# Altium project NB3000AL.PRJPCB (part 1 of 4)
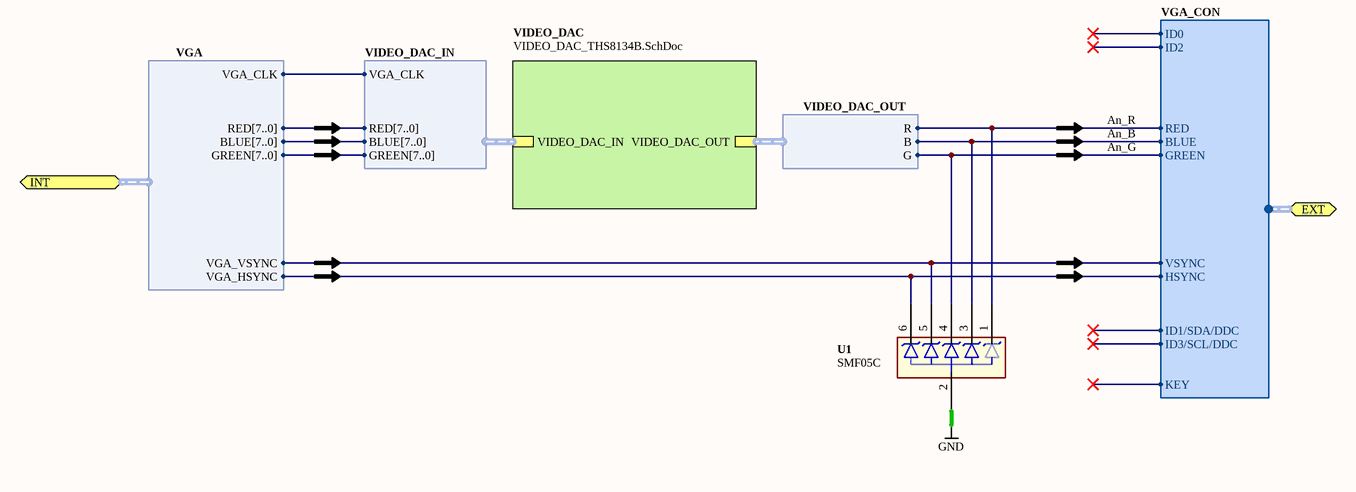
[diagram p0: VGA_OUT.SCHDOC]
ProjectAddress1: 3 Minna Close; ProjectAddress2: Belrose; ProjectAddress3: NSW 2085; ProjectAddress4: Australia; ProjectAssyNum: D-820-0053; ProjectOrganization: Altium Limited; ProjectRevision: 01; ProjectTitle: NB3000AL - Altera; ProjectTotalSheets: 106
38 sheets, 516 parts. Net scope: hierarchical (ports join the sheet entries above them; power ports are global).
Board files: NB3000AL.PcbDoc, NB3000AL_Panel.PcbDoc
Sheets:
  VGA_OUT.SCHDOC
    VIDEO_DAC = VIDEO_DAC_THS8134B.SchDoc
  Audio_Codec.SchDoc
    CODEC_CS4270 = AUDIO_CODEC_CS4270.SchDoc
  PSU.SchDoc
  FPGA.SCHDOC
    USER_DECOUPLING_CAPS_1V2 = FPGA_Bypass_1V2.SCHDOC
    USER_DECOUPLING_CAPS_3V3 = FPGA_Bypass_3V3.SCHDOC
    U_FPGA_Power = FPGA_NonIO.SchDoc
    PULLDOWN = PULLDNx3.SCHDOC
    PULLDOWN = PULLDNx3.SCHDOC
    PULLDOWN = PULLDNx3.SCHDOC
    PULLDOWN = PULLDNx3.SCHDOC
    PULLDOWN = PULLDNx3.SCHDOC
    PULLDOWN = PULLDNx3.SCHDOC
    PULLDOWN = PULLDNx3.SCHDOC
    PULLDOWN = PULLDNx3.SCHDOC
  LED_RGB_SMDx8.SCHDOC
  PWJACK+SWITCH.SchDoc
  Ethernet_RTL8201CL.SchDoc
  HOST_JTAG.SchDoc
  USERPWR.SchDoc
  Host_FPGA.SchDoc
    HOST_NonIO = HOST_FPGA_NonIO.SchDoc
    HOST_DECOUPLING_CAPS_1V2 = FPGA_Bypass_1V2.SCHDOC
    HOST_DECOUPLING_CAPS_3V3 = FPGA_Bypass_3V3.SCHDOC
    PULLDOWN = PULLDNx3.SCHDOC
    PULLDOWN = PULLDNx3.SCHDOC
  TSC_XPT2046.SchDoc
  USB_CY7C68001-56LFC.SchDoc
  OSC_24MHZ.SchDoc
  CON_AUDIO_AC99_NOMIC.SchDoc
  CON_FFC40_LCDTFT.SCHDOC
  Mounts.SchDoc
  ADC_ADC084S021_SPI.SchDoc
  CON_NB3000_ATE_INTF.SchDoc
  AUDIO_AMP_NB2C.SchDoc
    AMP_PT2300 = AUDIO_AMP_PT2300.SchDoc
  CLK_ICS307-02_PLL.SchDoc
  CON_ADCx4_KMRJIO3_5MM_6WAY.SchDoc
  CON_BATT_COIN.SchDoc
  CON_DACx4_KMRJIO3_5MM_6WAY.SchDoc
  CON_MINI_USBB_RA_KME04-USBMU03A01-1.SchDoc
  CON_ETHERNET_RJ45_LEDS.SchDoc
  CON_NB3000_LEDKB.SCHDOC
  CON_MIDI_DIN5.SCHDOC
  CON_EXT_SPK.SchDoc
  1WB_DS2502_ID.SchDoc
  CLK_PCF2123_RTC.SchDoc

## Sheet VGA_OUT.SCHDOC: VGA Ouput
size A4; DocumentNumber: 2; PageSetup: Record=PageOptions|CenterHorizontal=True|CenterVertical=True|PrintScale=0.97|XCorrection=1.00|YCorrection=1.00|PrintKind=1|BorderSize=5000000|LeftOffset=0|BottomOffset=0|Orientation=2|PaperLength=1000|PaperWidth=1000|Scale=100|PaperSource=7|PrintQuality=-4|MediaType=1|DitherType=10|PaperKind=A4 (210 x 297 mm)|PrintScaleMode=1

### Parts
(Parts that share a designator on the sheet are numbered #1, #2 ... from top to bottom, then left to right.)
U1#1  SMF05C  [SC70_6L]

### Sub-sheets
VIDEO_DAC = VIDEO_DAC_THS8134B.SchDoc: VIDEO_DAC_OUT (harness VIDEO_DAC_OUT), VIDEO_DAC_IN (harness VIDEO_DAC_IN)

### Ports
EXT (harness VGA_CON), INT (harness VGA)

### Harnesses
VIDEO_DAC_IN: RED[7..0], GREEN[7..0], BLUE[7..0], VGA_CLK
VIDEO_DAC_OUT: B, R, G
VGA: RED[7..0], GREEN[7..0], BLUE[7..0], VGA_CLK, VGA_VSYNC, VGA_HSYNC
VGA_CON: RED, GREEN, BLUE, VSYNC, HSYNC, KEY, ID2, ID3/SCL/DDC, ID1/SDA/DDC, ID0

### Nets
GND: U1#1.2
An_B: U1#1.3 ; sheet VIDEO_DAC/VIDEO_DAC_OUT.B, port EXT.BLUE
An_G: U1#1.4 ; sheet VIDEO_DAC/VIDEO_DAC_OUT.G, port EXT.GREEN
An_R: U1#1.1 ; sheet VIDEO_DAC/VIDEO_DAC_OUT.R, port EXT.RED
NetU1#1_5: U1#1.5 ; port INT.VGA_VSYNC, port EXT.VSYNC
NetU1#1_6: U1#1.6 ; port INT.VGA_HSYNC, port EXT.HSYNC
NetU1#2_26: sheet VIDEO_DAC/VIDEO_DAC_IN.VGA_CLK, port INT.VGA_CLK

### Notes on the sheet
- Sheet Title
- Project Title
- Size:
- Date:
- A4
- Assy:
- Time:
- Revision:
- Sheet
- of
- File:

### Library data of the parts
U1#1 = D-157-0000: TVS Diode Array  For ESD and Latch-Up Protection; Junction Capacitance: 130 pF; Peak Pulse Current: 8 A; Peak Pulse Power: 100 W; Reverse Breakdown Voltage: 6 V; Status: Unreleased; Category: Diode-Protection

## Sheet VIDEO_DAC_THS8134B.SchDoc: Video DAC
size A4; Organization: Altium Limited.; Address1: Level 3, 12a Rodborough Rd; Address2: Frenchs Forest 2086; Address3: NSW; Address4: AUSTRALIA; DocumentNumber: 62; SheetNumber: 63; SheetTotal: 78
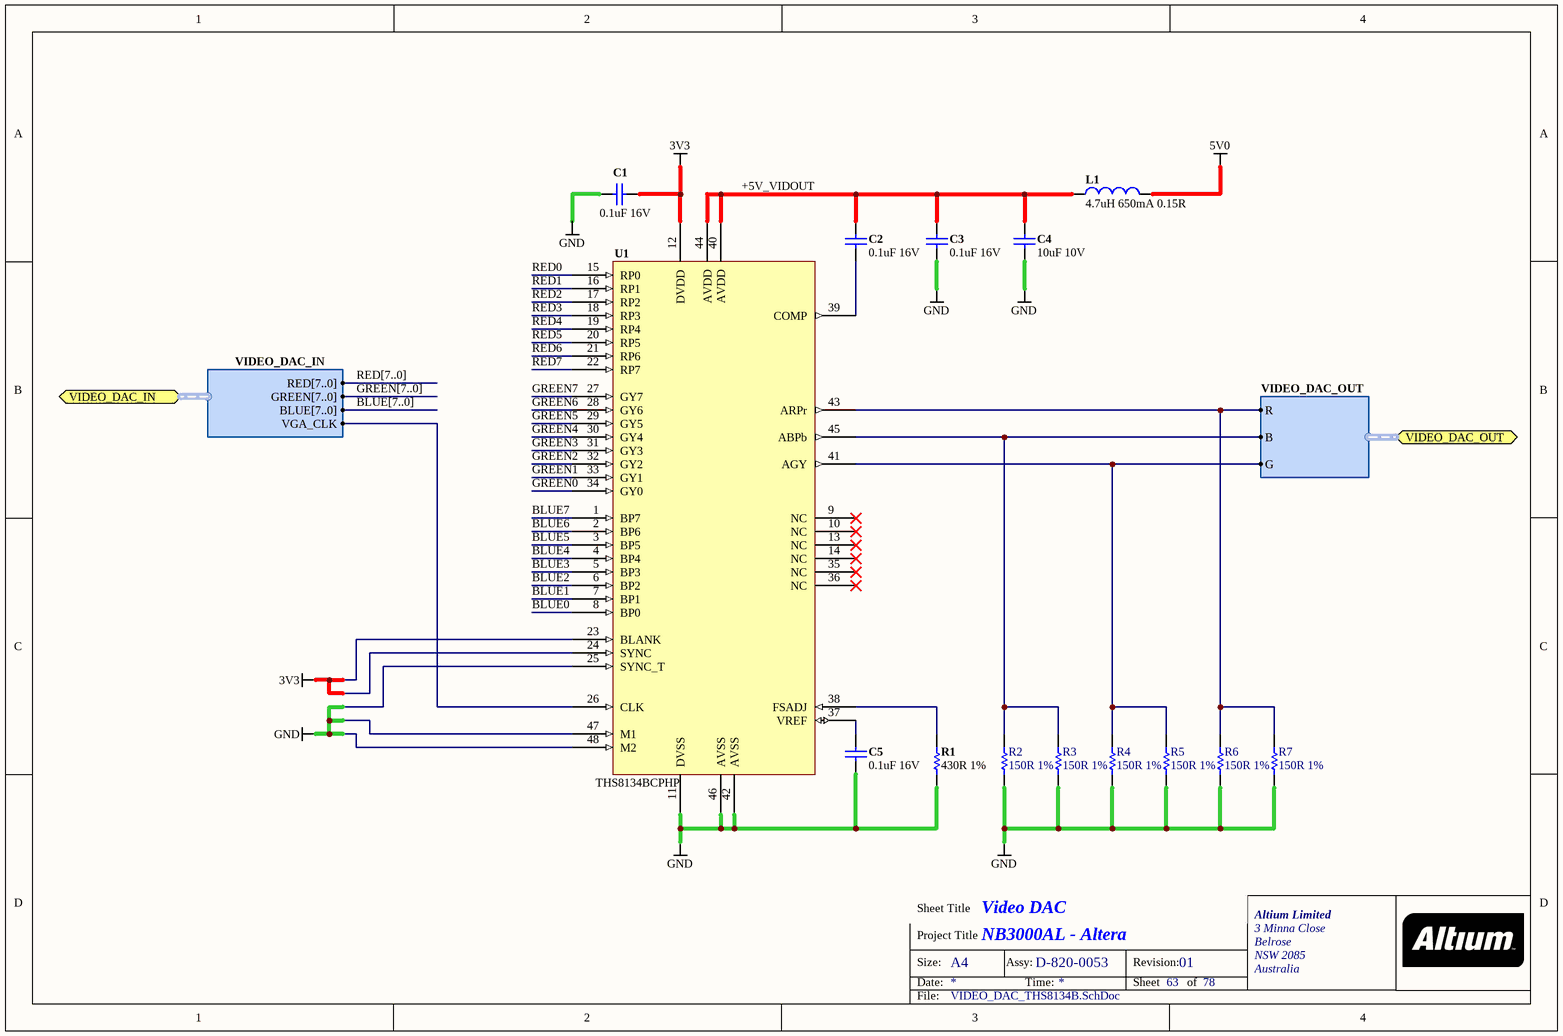
[diagram p1: VIDEO_DAC_THS8134B.SchDoc]

### Parts
(Parts that share a designator on the sheet are numbered #1, #2 ... from top to bottom, then left to right.)
C1#1  0.1uF 16V  [CAPC1005-STAR]
C2#1  0.1uF 16V  [CAPC1005-STAR]
C3#1  0.1uF 16V  [CAPC1005-STAR]
C4#1  10uF 10V  [CAPC2012-STAR]
C5#1  0.1uF 16V  [CAPC1005-STAR]
L1#1  4.7uH 650mA 0.15R  [INDC3225]
R1#1  430R 1%  [RESC1005-STAR]
R2#1  150R 1%  [RESC1005-STAR]
R3#1  150R 1%  [RESC1005-STAR]
R4#1  150R 1%  [RESC1005-STAR]
R5#1  150R 1%  [RESC1005-STAR]
R6#1  150R 1%  [RESC1005-STAR]
R7#1  150R 1%  [RESC1005-STAR]
U1#2  THS8134BCPHP  [TSQFP50P900X900_HS-48]

### Ports
VIDEO_DAC_IN (harness VIDEO_DAC_IN), VIDEO_DAC_OUT (harness VIDEO_DAC_OUT)

### Harnesses
VIDEO_DAC_OUT: B, R, G
VIDEO_DAC_IN: RED[7..0], GREEN[7..0], BLUE[7..0], VGA_CLK

### Nets
3V3: C1#1.1 U1#2.12(DVDD) U1#2.23(BLANK) U1#2.24(SYNC)
5V0: L1#1.1
GND: C1#1.2 C3#1.2 C4#1.1 C5#1.2 R1#1.1 R2#1.2 R3#1.1 R4#1.2 R5#1.1 R6#1.1 R7#1.1 U1#2.11(DVSS) U1#2.25(SYNC_T) U1#2.42(AVSS) U1#2.46(AVSS) U1#2.47(M1) U1#2.48(M2)
+5V_VIDOUT: C2#1.1 C3#1.1 C4#1.2 L1#1.2 U1#2.40(AVDD) U1#2.44(AVDD)
An_B: R2#1.1 R3#1.2 U1#2.45(ABPb) ; port VIDEO_DAC_OUT.B
An_G: R4#1.1 R5#1.2 U1#2.41(AGY) ; port VIDEO_DAC_OUT.G
An_R: R6#1.2 R7#1.2 U1#2.43(ARPr) ; port VIDEO_DAC_OUT.R
BLUE0: U1#2.8(BP0)
BLUE1: U1#2.7(BP1)
BLUE2: U1#2.6(BP2)
BLUE3: U1#2.5(BP3)
BLUE4: U1#2.4(BP4)
BLUE5: U1#2.3(BP5)
BLUE6: U1#2.2(BP6)
BLUE7: U1#2.1(BP7)
GREEN0: U1#2.34(GY0)
GREEN1: U1#2.33(GY1)
GREEN2: U1#2.32(GY2)
GREEN3: U1#2.31(GY3)
GREEN4: U1#2.30(GY4)
GREEN5: U1#2.29(GY5)
GREEN6: U1#2.28(GY6)
GREEN7: U1#2.27(GY7)
RED0: U1#2.15(RP0)
RED1: U1#2.16(RP1)
RED2: U1#2.17(RP2)
RED3: U1#2.18(RP3)
RED4: U1#2.19(RP4)
RED5: U1#2.20(RP5)
RED6: U1#2.21(RP6)
RED7: U1#2.22(RP7)
NetC2#1_2: C2#1.2 U1#2.39(COMP)
NetC5#1_1: C5#1.1 U1#2.37(VREF)
NetR1#1_2: R1#1.2 U1#2.38(FSADJ)
NetU1#2_26: U1#2.26(CLK) ; port VIDEO_DAC_IN.VGA_CLK

Not connected (* = marked no-connect by the designer): U1#2 9(NC)* 10(NC)* 13(NC)* 14(NC)* 35(NC)* 36(NC)*

### Buses and harness runs
bus BLUE[7..0]
bus GREEN[7..0]
bus RED[7..0]

### Notes on the sheet
- Sheet Title
- Project Title
- Size:
- Date:
- A4
- Assy:
- Time:
- Revision:
- Sheet
- of
- File:

### Library data of the parts
C1#1 C2#1 C3#1 C5#1 = D-101-0080: Capacitor, Ceramic, 0.1uF 10% 16V 0402 (1005) X7R; Polarity: Non-Polarized; Capacitance: 0.1 uF; Category: Capacitor; Dielectric: X7R; Mounting Technology: Surface Mount; Rated Voltage: 16 V; Status: Production; Technology: Ceramic; Tolerance: 10 %
C4#1 = D-101-0087: Capacitor, Ceramic, 10uF 10% 10V 0805 (2012) X5R; Polarity: Non-Polarized; Capacitance: 10 uF; Category: Capacitor; Dielectric: X5R; Mounting Technology: Surface Mount; Rated Voltage: 10 V; Status: Unreleased; Technology: None; Tolerance: 10 %
L1#1 = D-102-0005: Inductor, 4.7uH 650mA 0.15R 1210 (3225) LQH32CN4R7M11L; Category: Inductor; Status: Production
R1#1 = D-100-0096: Resistor, 430R 1% 0402 (1005); Power Rating: 63 mW; Category: Resistor; Mounting Technology: Surface Mount; Resistance: 430 R; Status: Production; Tolerance: 1 %
R2#1 R3#1 R4#1 R5#1 R6#1 R7#1 = D-100-0005: Resistor, 150R 1% 0402 (1005); Power Rating: 63mW; Category: Resistor; Mounting Technology: Surface Mount; Resistance: 150R; Status: Unreleased; Tolerance: 1%
U1#2 = D-222-0000: THS8134BCPHP, Triple 8-Bit, 80 MSPS Video DAC with Tri-Level Sync Generation; Status: Production; Category: IC-DAC

## Sheet Audio_Codec.SchDoc: Audio CODEC Top
size A4; DocumentNumber: 4
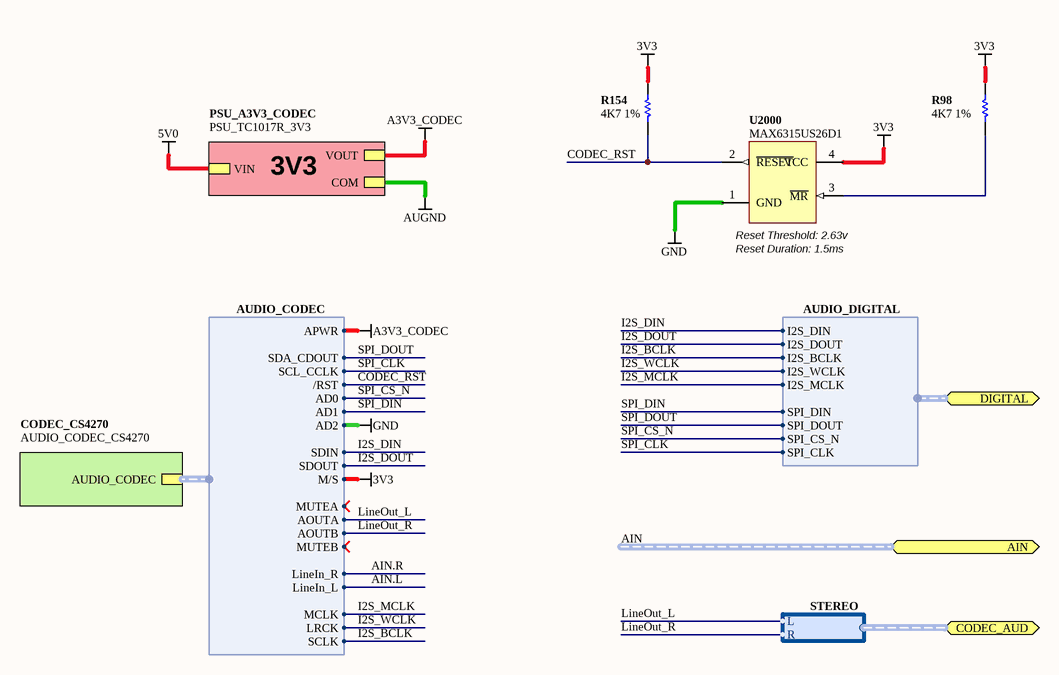
[diagram p2: Audio_Codec.SchDoc]

### Parts
(Parts that share a designator on the sheet are numbered #1, #2 ... from top to bottom, then left to right.)
R98  4K7 1%  [RESC1005-STAR]
R154#1  4K7 1%  [RESC1005-STAR]
U2000  MAX6315US26D1  [SOT143]

### Sub-sheets
CODEC_CS4270 = AUDIO_CODEC_CS4270: AUDIO_CODEC (harness AUDIO_CODEC)
PSU_A3V3_CODEC = PSU_TC1017R_3V3 (file not in this document): VIN, VOUT, COM

### Ports
AIN (harness AUDIO_IN), CODEC_AUD (harness STEREO), DIGITAL (harness AUDIO_DIGITAL)

### Harnesses
AUDIO_CODEC: SDOUT, SDIN, SCLK, LRCK, MCLK, M/S, LineIn_L, LineIn_R, AOUTA, AOUTB, APWR, SCL_CCLK, AD1, SDA_CDOUT, AD0, AD2, /RST, MUTEA, MUTEB
AUDIO_DIGITAL: I2S_DOUT, I2S_DIN, I2S_BCLK, I2S_WCLK, I2S_MCLK, SPI_CLK, SPI_DIN, SPI_DOUT, SPI_CS_N
STEREO: L, R

### Nets
3V3: R98.2 R154#1.2 U2000.4(VCC) ; sheet CODEC_CS4270/AUDIO_CODEC.M/S
A3V3_CODEC: sheet PSU_A3V3_CODEC/VOUT, sheet CODEC_CS4270/AUDIO_CODEC.APWR
GND: U2000.1(GND) ; sheet CODEC_CS4270/AUDIO_CODEC.AD2
CODEC_RST: R154#1.1 U2000.2(~{RESET}) ; sheet CODEC_CS4270/AUDIO_CODEC./RST
I2S_BCLK: sheet CODEC_CS4270/AUDIO_CODEC.SCLK, port DIGITAL.I2S_BCLK
I2S_DIN: sheet CODEC_CS4270/AUDIO_CODEC.SDIN, port DIGITAL.I2S_DIN
I2S_DOUT: sheet CODEC_CS4270/AUDIO_CODEC.SDOUT, port DIGITAL.I2S_DOUT
I2S_MCLK: sheet CODEC_CS4270/AUDIO_CODEC.MCLK, port DIGITAL.I2S_MCLK
I2S_WCLK: sheet CODEC_CS4270/AUDIO_CODEC.LRCK, port DIGITAL.I2S_WCLK
LineOut_L: sheet CODEC_CS4270/AUDIO_CODEC.AOUTA, port CODEC_AUD.L
LineOut_R: sheet CODEC_CS4270/AUDIO_CODEC.AOUTB, port CODEC_AUD.R
SPI_CLK: sheet CODEC_CS4270/AUDIO_CODEC.SCL_CCLK, port DIGITAL.SPI_CLK
SPI_CS_N: sheet CODEC_CS4270/AUDIO_CODEC.AD0, port DIGITAL.SPI_CS_N
SPI_DIN: sheet CODEC_CS4270/AUDIO_CODEC.AD1, port DIGITAL.SPI_DIN
SPI_DOUT: sheet CODEC_CS4270/AUDIO_CODEC.SDA_CDOUT, port DIGITAL.SPI_DOUT
NetR98_1: R98.1 U2000.3(~{MR})

### Buses and harness runs
harness AIN = port AIN

### Notes on the sheet
- 3V3
- (near U2000) Reset Threshold: 2.63v
- (near U2000) Reset Duration: 1.5ms
- Sheet Title
- Project Title
- Size:
- Date:
- A4
- Assy:
- Time:
- Revision:
- Sheet
- of
- File:

### Library data of the parts
R98 R154#1 = D-100-0088: Resistor, 4K7 1% 0402 (1005); Power Rating: 63 mW; Resistance: 4.7 K; Category: Resistor; Mounting Technology: Surface Mount; Status: Production; Tolerance: 1 %
U2000 = D-243-0000: MAX6315, Open-Drain Output SOT Reset IC, Customized Reset Thresholds, Timeout Delays; Category: IC-Other; Status: Production

## Sheet AUDIO_CODEC_CS4270.SchDoc: Audio CODEC
size A4; DocumentNumber: 5; SheetNumber: 5; SheetTotal: 100; Organization: Altium Limited.; Address1: Level 3, 12a Rodborough Rd; Address2: Frenchs Forest 2086; Address3: NSW; Address4: AUSTRALIA
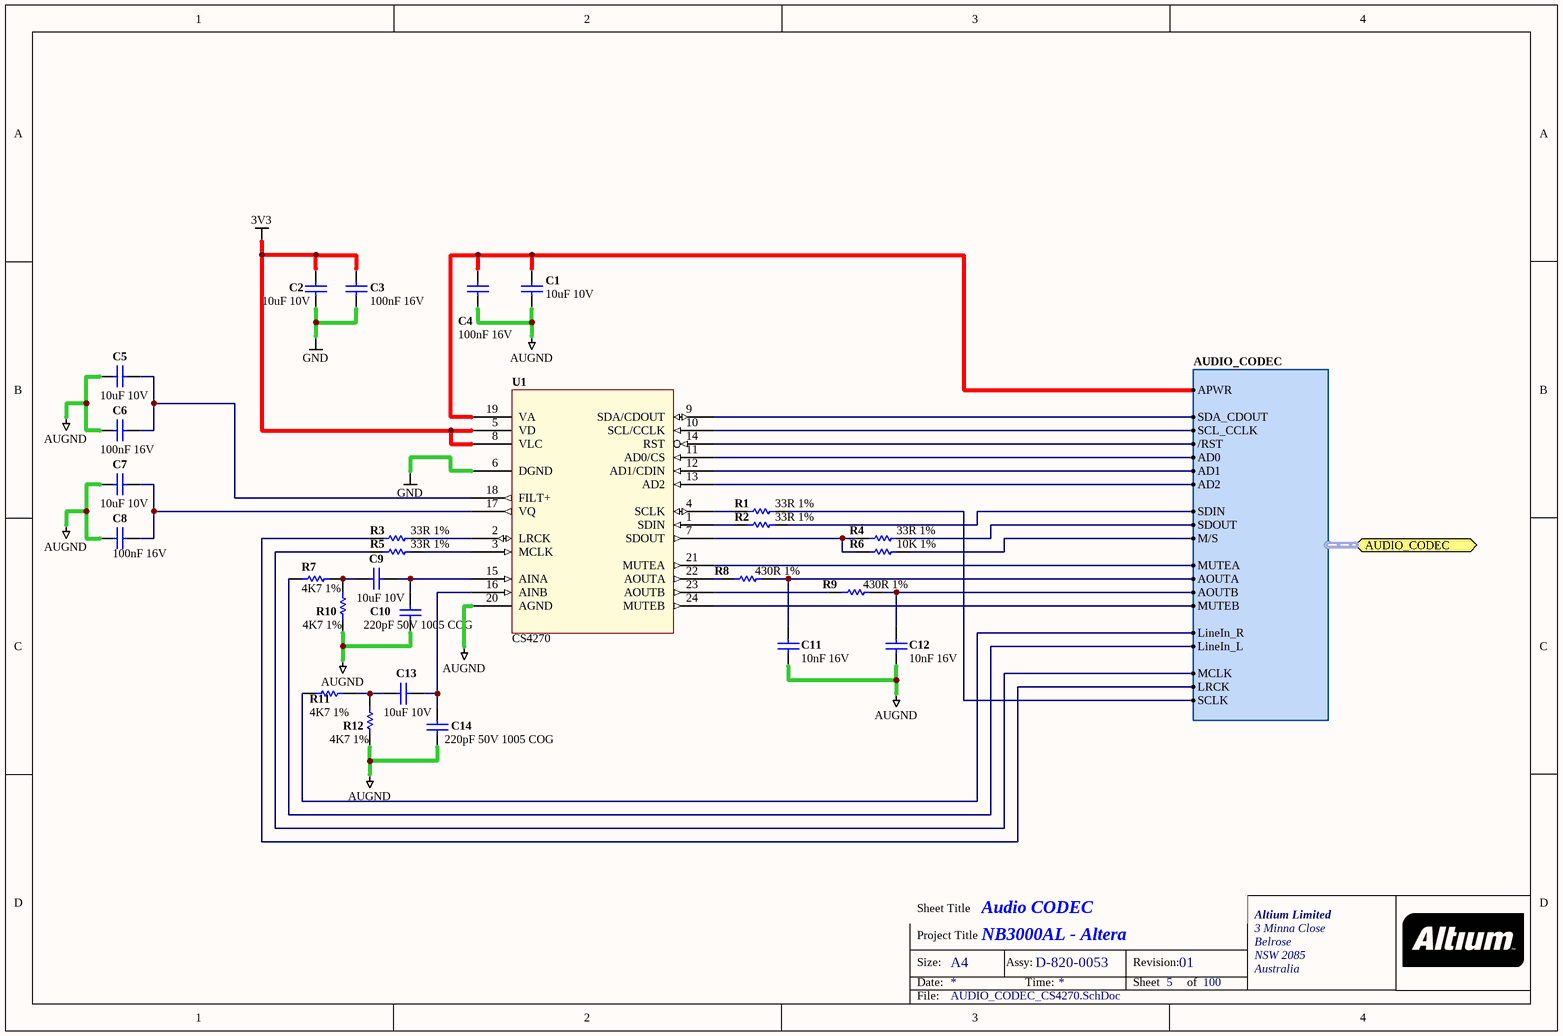
[diagram p3: AUDIO_CODEC_CS4270.SchDoc]

### Parts
(Parts that share a designator on the sheet are numbered #1, #2 ... from top to bottom, then left to right.)
C1#2  10uF 10V  [CAPC2012-STAR]
C2#2  10uF 10V  [CAPC2012-STAR]
C3#2  100nF 16V  [CAPC1005-STAR]
C4#2  100nF 16V  [CAPC1005-STAR]
C5#2  10uF 10V  [CAPC2012-STAR]
C6#1  100nF 16V  [CAPC1005-STAR]
C7#1  10uF 10V  [CAPC2012-STAR]
C8#1  100nF 16V  [CAPC1005-STAR]
C9#1  10uF 10V  [CAPC2012-STAR]
C10#1  220pF 50V 1005 COG  [CAPC1005-STAR]
C11#1  10nF 16V  [CAPC1005-STAR]
C12#1  10nF 16V  [CAPC1005-STAR]
C13#1  10uF 10V  [CAPC2012-STAR]
C14#1  220pF 50V 1005 COG  [CAPC1005-STAR]
R1#2  33R 1%  [RESC1005-STAR]
R2#2  33R 1%  [RESC1005-STAR]
R3#2  33R 1%  [RESC1005-STAR]
R4#2  33R 1%  [RESC1005-STAR]
R5#2  33R 1%  [RESC1005-STAR]
R6#2  10K 1%  [RESC1005-STAR]
R7#2  4K7 1%  [RESC1005-STAR]
R8#1  430R 1%  [RESC1005-STAR]
R9#1  430R 1%  [RESC1005-STAR]
R10#1  4K7 1%  [RESC1005-STAR]
R11#1  4K7 1%  [RESC1005-STAR]
R12#1  4K7 1%  [RESC1005-STAR]
U1#3  CS4270  [TSSOP-24]

### Ports
AUDIO_CODEC (harness AUDIO_CODEC)

### Harnesses
AUDIO_CODEC: SDOUT, SDIN, SCLK, LRCK, MCLK, M/S, LineIn_L, LineIn_R, AOUTA, AOUTB, APWR, SCL_CCLK, AD1, SDA_CDOUT, AD0, AD2, /RST, MUTEA, MUTEB

### Nets
3V3: C2#2.1 C3#2.1 R6#2.1 U1#3.5(VD) U1#3.8(VLC) ; port AUDIO_CODEC.M/S
A3V3_CODEC: C1#2.1 C4#2.1 U1#3.19(VA) ; port AUDIO_CODEC.APWR
AUGND: C1#2.2 C4#2.2 C5#2.2 C6#1.1 C7#1.2 C8#1.2 C10#1.2 C11#1.2 C12#1.2 C14#1.2 R10#1.1 R12#1.1 U1#3.20(AGND)
GND: C2#2.2 C3#2.2 U1#3.6(DGND) U1#3.13(AD2) ; port AUDIO_CODEC.AD2
AIN.L: R7#2.1 ; port AUDIO_CODEC.LineIn_L
AIN.R: R11#1.1 ; port AUDIO_CODEC.LineIn_R
CODEC_RST: U1#3.14(RST) ; port AUDIO_CODEC./RST
I2S_BCLK: R1#2.2 ; port AUDIO_CODEC.SCLK
I2S_DIN: R2#2.2 ; port AUDIO_CODEC.SDIN
I2S_DOUT: R4#2.2 ; port AUDIO_CODEC.SDOUT
I2S_MCLK: R5#2.1 ; port AUDIO_CODEC.MCLK
I2S_WCLK: R3#2.1 ; port AUDIO_CODEC.LRCK
LineOut_L: C11#1.1 R8#1.1 ; port AUDIO_CODEC.AOUTA
LineOut_R: C12#1.1 R9#1.1 ; port AUDIO_CODEC.AOUTB
SPI_CLK: U1#3.10(SCL/CCLK) ; port AUDIO_CODEC.SCL_CCLK
SPI_CS_N: U1#3.11(AD0/CS) ; port AUDIO_CODEC.AD0
SPI_DIN: U1#3.12(AD1/CDIN) ; port AUDIO_CODEC.AD1
SPI_DOUT: U1#3.9(SDA/CDOUT) ; port AUDIO_CODEC.SDA_CDOUT
NetC5#2_1: C5#2.1 C6#1.2 U1#3.18(FILT+)
NetC7#1_1: C7#1.1 C8#1.1 U1#3.17(VQ)
NetC9#1_1: C9#1.1 C10#1.1 U1#3.15(AINA)
NetC9#1_2: C9#1.2 R7#2.2 R10#1.2
NetC13#1_1: C13#1.1 C14#1.1 U1#3.16(AINB)
NetC13#1_2: C13#1.2 R11#1.2 R12#1.2
NetR1#2_1: R1#2.1 U1#3.4(SCLK)
NetR2#2_1: R2#2.1 U1#3.1(SDIN)
NetR3#2_2: R3#2.2 U1#3.2(LRCK)
NetR4#2_1: R4#2.1 R6#2.2 U1#3.7(SDOUT)
NetR5#2_2: R5#2.2 U1#3.3(MCLK)
NetR8#1_2: R8#1.2 U1#3.22(AOUTA)
NetR9#1_2: R9#1.2 U1#3.23(AOUTB)
NetU1#3_21: U1#3.21(MUTEA) ; port AUDIO_CODEC.MUTEA
NetU1#3_24: U1#3.24(MUTEB) ; port AUDIO_CODEC.MUTEB

### Notes on the sheet
- Sheet Title
- Project Title
- Size:
- Date:
- A4
- Assy:
- Time:
- Revision:
- Sheet
- of
- File:

### Library data of the parts
C1#2 C2#2 C5#2 C7#1 C9#1 C13#1 = D-101-0087: as C4#1 on sheet VIDEO_DAC_THS8134B; Capacitance: 10 uF; Dielectric: X5R; Mounting Technology: Surface Mount; Rated Voltage: 10 V; Status: Unreleased; Technology: None; Tolerance: 10 %; Category: Capacitor
C3#2 C4#2 C6#1 C8#1 = D-101-0062: Capacitor, Ceramic, 100nF 10% 16V 0402 (1005) X7R; Polarity: Non-Polarized; Capacitance: 100 nF; Dielectric: X7R; Mounting Technology: Surface Mount; Rated Voltage: 16 V; Status: Unreleased; Technology: Ceramic; Tolerance: 10 %; Category: Capacitor
C10#1 C14#1 = D-101-0064: Capacitor, Ceramic, 220pF 5% 50V 0402 (1005) COG; Polarity: Non-Polarized; Capacitance: 220 pF; Dielectric: COG; Mounting Technology: Surface Mount; Rated Voltage: 50 V; Status: Unreleased; Technology: Ceramic; Tolerance: 5 %; Category: Capacitor
C11#1 C12#1 = D-101-0077: Capacitor, Ceramic, 10nF 10% 16V 0402 (1005) X7R; Polarity: Non-Polarized; Capacitance: 10 nF; Category: Capacitor; Dielectric: X7R; Mounting Technology: Surface Mount; Rated Voltage: 16 V; Status: Production; Technology: Ceramic; Tolerance: 10 %
R1#2 R2#2 R3#2 R4#2 R5#2 = D-100-0102: Resistor, 33R 1% 0402 (1005); Power Rating: 63 mW; Mounting Technology: Surface Mount; Resistance: 33 R; Status: Production; Tolerance: 1 %; Category: Resistor
R6#2 = D-100-0130: Resistor, 10K 1% 0402 (1005); Power Rating: 63 mW; Mounting Technology: Surface Mount; Resistance: 10 K; Status: Production; Tolerance: 1 %; Category: Resistor
R7#2 R10#1 R11#1 R12#1 = D-100-0088: as R98 on sheet Audio_Codec; Mounting Technology: Surface Mount; Status: Production; Tolerance: 1 %; Category: Resistor
R8#1 R9#1 = D-100-0096: as R1#1 on sheet VIDEO_DAC_THS8134B; Category: Resistor; Mounting Technology: Surface Mount; Resistance: 430 R; Status: Production; Tolerance: 1 %
U1#3 = D-201-0003: CS4270; 24-Bit, 192 kHz Stereo Audio CODEC; AudioICTypes: Amplifier; Supply Voltage: mV; Mounting Technology: Surface Mount; Status: Unreleased; Category: IC-Audio

## Sheet PSU.SchDoc: NB3000 POWER SUPPLIES
size A4; Organization: Altium Limited.; DocumentNumber: 7; Revision: 6
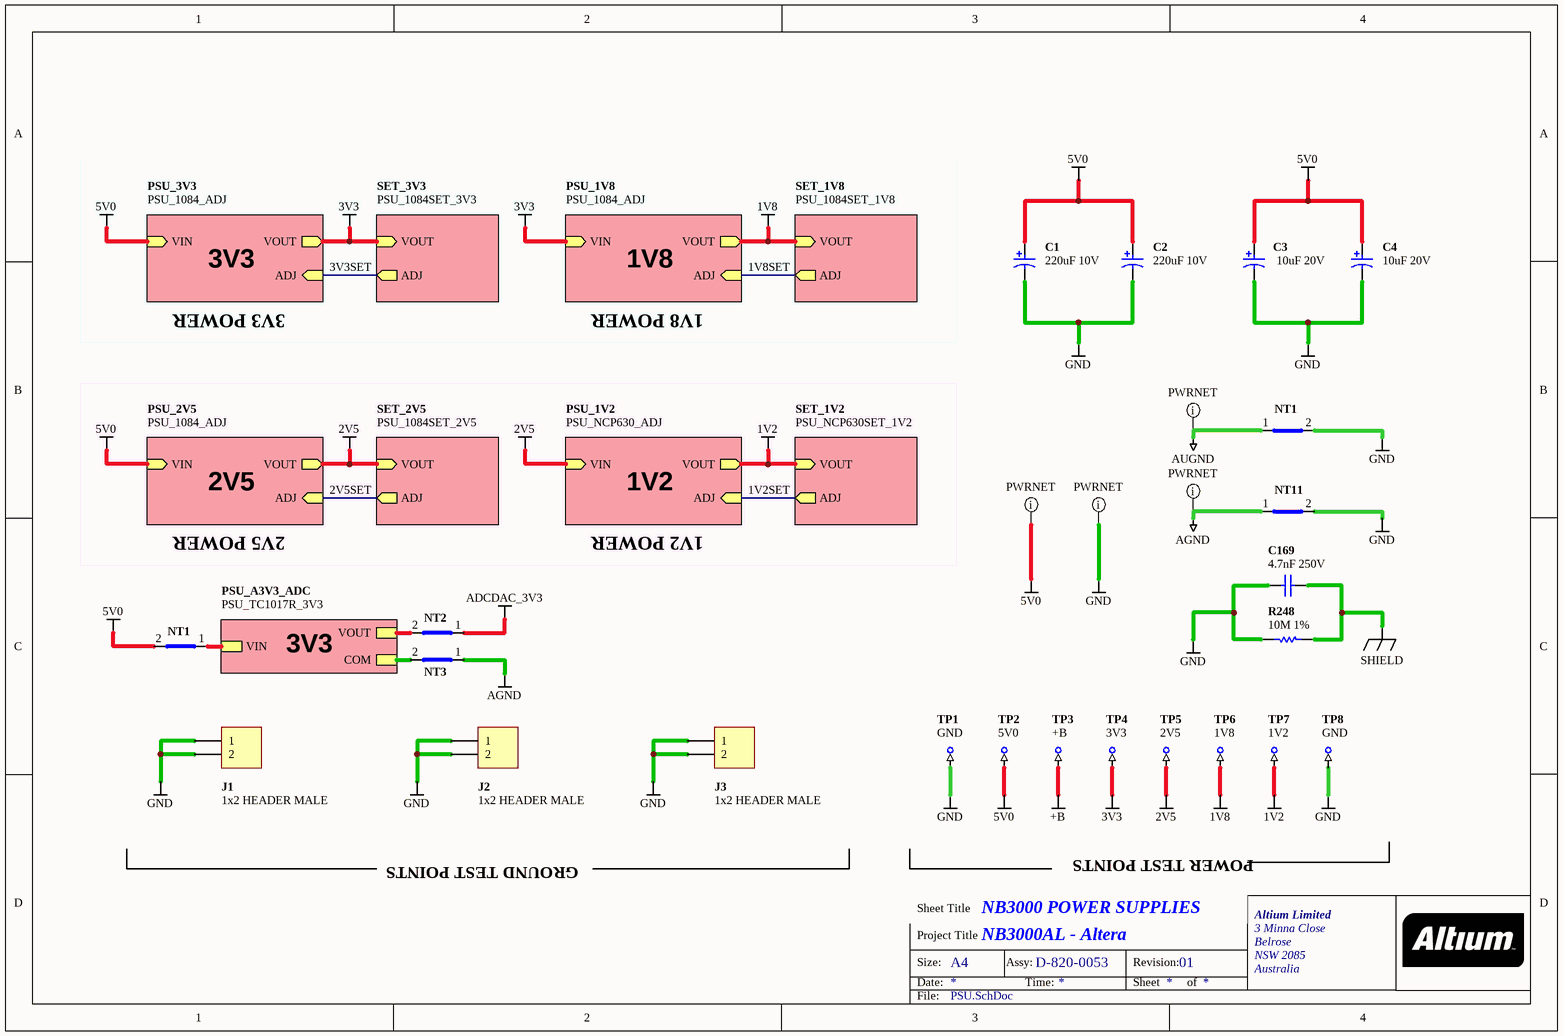
[diagram p4: PSU.SchDoc]

### Parts
(Parts that share a designator on the sheet are numbered #1, #2 ... from top to bottom, then left to right.)
C1#3  220uF 10V  [CAPC7343-STAR]
C2#3  220uF 10V  [CAPC7343-STAR]
C3#3  10uF 20V  [CAPC3528-STAR]
C4#3  10uF 20V  [CAPC3528-STAR]
C169  4.7nF 250V  [CAPM7163]
J1#1  1x2 HEADER MALE  [HDR1X2]
J2#1  1x2 HEADER MALE  [HDR1X2]
J3#1  1x2 HEADER MALE  [HDR1X2]
NT1#1  Net Tie SMT2  [NETTIE-SMT2-31X39]  (value not drawn)  (net tie, no BOM)
NT1#2  Net Tie SMT2  [NETTIE-SMT2-31X51]  (value not drawn)  (net tie, no BOM)
NT2#1  Net Tie SMT2  [NETTIE-SMT2-31X51]  (value not drawn)  (net tie, no BOM)
NT3#1  Net Tie SMT2  [NETTIE-SMT2-31X51]  (value not drawn)  (net tie, no BOM)
NT11#1  Net Tie SMT2  [NETTIE-SMT2-8X8]  (value not drawn)  (net tie, no BOM)
R248  10M 1%  [RESC3216]
TP1#1  GND  [TestPin]  (no BOM)
TP2#1  5V0  [TestPin]  (no BOM)
TP3  +B  [TestPin]  (no BOM)
TP4  3V3  [TestPin]  (no BOM)
TP5  2V5  [TestPin]  (no BOM)
TP6  1V8  [TestPin]  (no BOM)
TP7  1V2  [TestPin]  (no BOM)
TP8  GND  [TestPin]  (no BOM)

### Sub-sheets
PSU_1V2 = PSU_NCP630_ADJ (file not in this document): VIN (in), VOUT (out), ADJ (in)
PSU_1V8 = PSU_1084_ADJ (file not in this document): VIN (in), VOUT (out), ADJ (in)
PSU_2V5 = PSU_1084_ADJ (file not in this document): VIN (in), VOUT (out), ADJ (in)
PSU_3V3 = PSU_1084_ADJ (file not in this document): VIN (in), VOUT (out), ADJ (in)
PSU_A3V3_ADC = PSU_TC1017R_3V3 (file not in this document): VIN, VOUT, COM
SET_1V2 = PSU_NCP630SET_1V2 (file not in this document): VOUT (in), ADJ (out)
SET_1V8 = PSU_1084SET_1V8 (file not in this document): VOUT (in), ADJ (out)
SET_2V5 = PSU_1084SET_2V5 (file not in this document): VOUT (in), ADJ (out)
SET_3V3 = PSU_1084SET_3V3 (file not in this document): VOUT (in), ADJ (out)

### Nets
1V2: TP7.1 ; sheet PSU_1V2/VOUT, sheet SET_1V2/VOUT
1V8: TP6.1 ; sheet PSU_1V8/VOUT, sheet SET_1V8/VOUT
2V5: TP5.1 ; sheet PSU_1V2/VIN, sheet PSU_2V5/VOUT, sheet SET_2V5/VOUT
3V3: TP4.1 ; sheet PSU_1V8/VIN, sheet PSU_3V3/VOUT, sheet SET_3V3/VOUT
5V0: C1#3.1 C2#3.1 C3#3.1 C4#3.1 NT1#2.2(Net2) TP2#1.1 ; sheet PSU_2V5/VIN, sheet PSU_3V3/VIN
+B: TP3.1
ADCDAC_3V3: NT2#1.1(Net1)
AGND: NT3#1.1(Net1) NT11#1.1(Net1)
AUGND: NT1#1.1(Net1)
GND: C1#3.2 C2#3.2 C3#3.2 C4#3.2 C169.2 J1#1.1 J1#1.2 J2#1.1 J2#1.2 J3#1.1 J3#1.2 NT1#1.2(Net2) NT11#1.2(Net2) R248.2 TP1#1.1 TP8.1
SHIELD: C169.1 R248.1
1V2SET: sheet PSU_1V2/ADJ, sheet SET_1V2/ADJ
1V8SET: sheet PSU_1V8/ADJ, sheet SET_1V8/ADJ
2V5SET: sheet PSU_2V5/ADJ, sheet SET_2V5/ADJ
3V3SET: sheet PSU_3V3/ADJ, sheet SET_3V3/ADJ
NetNT1#2_1: NT1#2.1(Net1) ; sheet PSU_A3V3_ADC/VIN
NetNT2#1_2: NT2#1.2(Net2) ; sheet PSU_A3V3_ADC/VOUT
NetNT3#1_2: NT3#1.2(Net2) ; sheet PSU_A3V3_ADC/COM

### Layout directives
net class PWRNET: 5V0, AGND, AUGND, GND

### Notes on the sheet
- 3V3
- 3V3 POWER
- 1V8
- 1V8 POWER
- 2V5
- 1V2
- 2V5 POWER
- 1V2 POWER
- POWER TEST POINTS
- GROUND TEST POINTS
- Sheet Title
- Project Title
- Size:
- Date:
- A4
- Assy:
- Time:
- Revision:
- Sheet
- of
- File:

### Library data of the parts
C1#3 C2#3 = D-101-0088: Capacitor, Tantalum, 220uF 10% 10V MCCT-D (7343-31); Polarity: Polarized; Category: Capacitor; Capacitance: 220 uF; Mounting Technology: Surface Mount; Rated Voltage: 10 V; Status: Unreleased; Technology: Tantalum; Tolerance: 10 %
C3#3 C4#3 = D-101-0007: Capacitor, Tantalum, 10uF 10% 20V MCCT-B (3528); Polarity: Polarized; Category: Capacitor; Status: Production; Capacitance: 10 uF; Mounting Technology: Surface Mount; Rated Voltage: 20 V; Technology: Tantalum; Tolerance: 10 %
C169 = D-101-0019: Capacitor, Ceramic, 4.7nF 20% 250V Panasonic BC J Lead (CAPM7163) Y5V; Polarity: Non-Polarized; Tolerance: 20% %; Category: Capacitor; Capacitance: 4.7 nF; Dielectric: Y5V; Mounting Technology: Surface Mount; Rated Voltage: 250 V; Status: Production; Technology: Ceramic
J1#1 J2#1 J3#1 = D-300-0020: Header IDC, 2 x 1 Pin Vertical 2.54mm Pitch (Non-Boxed, Male); Max Current: 3 A; Category: Connector; Connector type: Header; Mounting Technology: Through-Hole; Pin Count: 2; Status: Production
NT1#1 NT11#1 = D-002-0004: Net-Tie, Surface Mount, 2 x 2.0mm x 0.8mm SMT Pads - For 0.8mm Track; Status: Production; Category: Net-Tie
NT1#2 NT2#1 NT3#1 = D-002-0003: Net-Tie, Surface Mount, 2 x 1.6mm x 0.8mm SMT Pads - For 0.8mm Track; Category: Net-Tie; Status: Production
R248 = D-100-0059: Resistor, 10M 1%1206 (3216); Power Rating: 250 mW; Category: Resistor; Mounting Technology: Surface Mount; Resistance: 10 M; Status: Deprecated; Tolerance: 1 %
TP1#1 TP2#1 TP3-TP8 = D-006-0000: Test Point, PCB Mount with Silkscreen Box; Category: Test-Point; Status: Production